# Altium project xiaozhi_speaker.PrjPcb
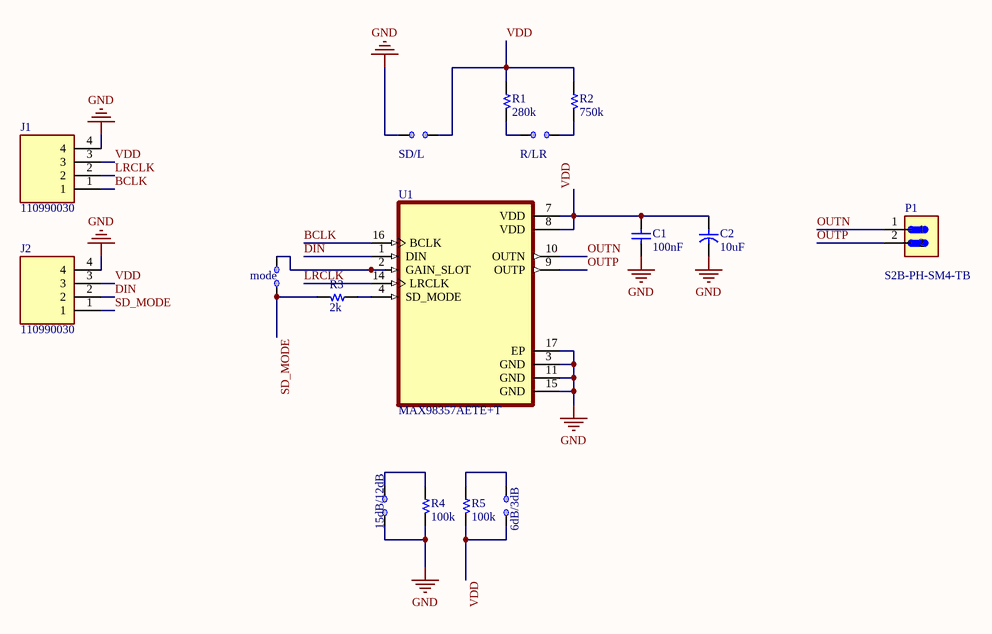
[diagram p0: xiaozhi_speaker.SchDoc]
1 sheet, 16 parts. Net scope: global (net labels, ports and power ports of the same name join across sheets).
Board file: xiaozhi_speaker.PcbDoc

## Sheet xiaozhi_speaker.SchDoc
size A; SheetNumber: 1; SheetTotal: 1

### Parts
6dB/3dB  JUMP 2 Open  [JUMP/2/SMD/0402]  (value not drawn)  (no BOM)
15dB/12dB  JUMP 2 Open  [JUMP/2/SMD/0402]  (value not drawn)  (no BOM)
C1  100nF  [C 0402]
C2  10uF  [C SMD TAN 1206 (A)]
J1  110990030  [SEEED_110990030]
J2  110990030  [SEEED_110990030]
mode  JUMP 2 Open  [JUMP/2/SMD/0402]  (value not drawn)  (no BOM)
P1  S2B-PH-SM4-TB  [JST_S2B-PH-SM4-TB]
R1  280k  [R 0603]
R2  750k  [R 0603]
R3  2k  [R 0603]
R4  100k  [R 0603]
R5  100k  [R 0603]
R/LR  JUMP 2 Open  [JUMP/2/SMD/0402]  (value not drawn)  (no BOM)
SD/L  JUMP 2 Open  [JUMP/2/SMD/0402]  (value not drawn)  (no BOM)
U1  MAX98357AETE+T  [QFN50P300X300X80-17N]

### Nets
GND: 15dB/12dB.1 C1.2 C2.2 J1.4 J2.4 R4.2 SD/L.1 U1.3(GND) U1.11(GND) U1.15(GND) U1.17(EP)
BCLK: J1.1 U1.16(BCLK)
DIN: J2.2 U1.1(DIN)
LRCLK: J1.2 U1.14(LRCLK)
OUTN: P1.1 U1.10(OUTN)
OUTP: P1.2 U1.9(OUTP)
SD_MODE: J2.1 mode.1 R3.2
VDD: 6dB/3dB.1 C1.1 C2.1 J1.3 J2.3 R1.1 R2.1 R5.2 SD/L.2 U1.7(VDD) U1.8(VDD)
Net6dB/3dB_2: 6dB/3dB.2 R5.1
Net15dB/12dB_2: 15dB/12dB.2 R4.1
Netmode_2: mode.2 U1.2(GAIN_SLOT)
NetR1_2: R1.2 R/LR.1
NetR2_2: R2.2 R/LR.2
NetR3_1: R3.1 U1.4(SD_MODE)

### Library data of the parts
C1 = Capacitor NP: Capacitor non-pol
C2 = Capacitor: Capacitor pol
J1 J2 = 110990030: GROVE 2MM 4PIN VERT CONN 10PCS; MF: Seeed Technology; SnapEDA_Link: https://www.snapeda.com/parts/110990030/Seeed+Studio/view-part/?ref=snap; Package: None; Value: *; MP: 110990030; Check_prices: https://www.snapeda.com/parts/110990030/Seeed+Studio/view-part/?ref=eda
P1 = S2B-PH-SM4-TB: Connector Header Surface Mount, Right Angle 2 position 0.079 (2.00mm); MF: JST Sales; SnapEDA_Link: https://www.snapeda.com/parts/S2B-PH-SM4-TB/JST/view-part/?ref=snap; Package: None; Value: *; MP: S2B-PH-SM4-TB; Check_prices: https://www.snapeda.com/parts/S2B-PH-SM4-TB/JST/view-part/?ref=eda
R1-R5 = Resistor
U1 = MAX98357AETE+T: Tiny, Low-Cost, PCM Class D Amplifier with Class AB Performance; MF: Analog Devices; SnapEDA_Link: https://www.snapeda.com/parts/MAX98357AETE+T/Analog+Devices/view-part/?ref=snap; Package: TQFN-16 Maxim; Value: *; MP: MAX98357AETE+T; Check_prices: https://www.snapeda.com/parts/MAX98357AETE+T/Analog+Devices/view-part/?ref=eda